# EasyEDA Pro project C8T6v1.eprj, schematic Schematic2
Board Name: Board1; Create Date: 2026-07-19; Page Name: P1; Project Name: 12; Schematic Name: Schematic2; Update Date: 2026-07-23; Company: 嘉立创EDA; Page Size: A4; Version: V1.0
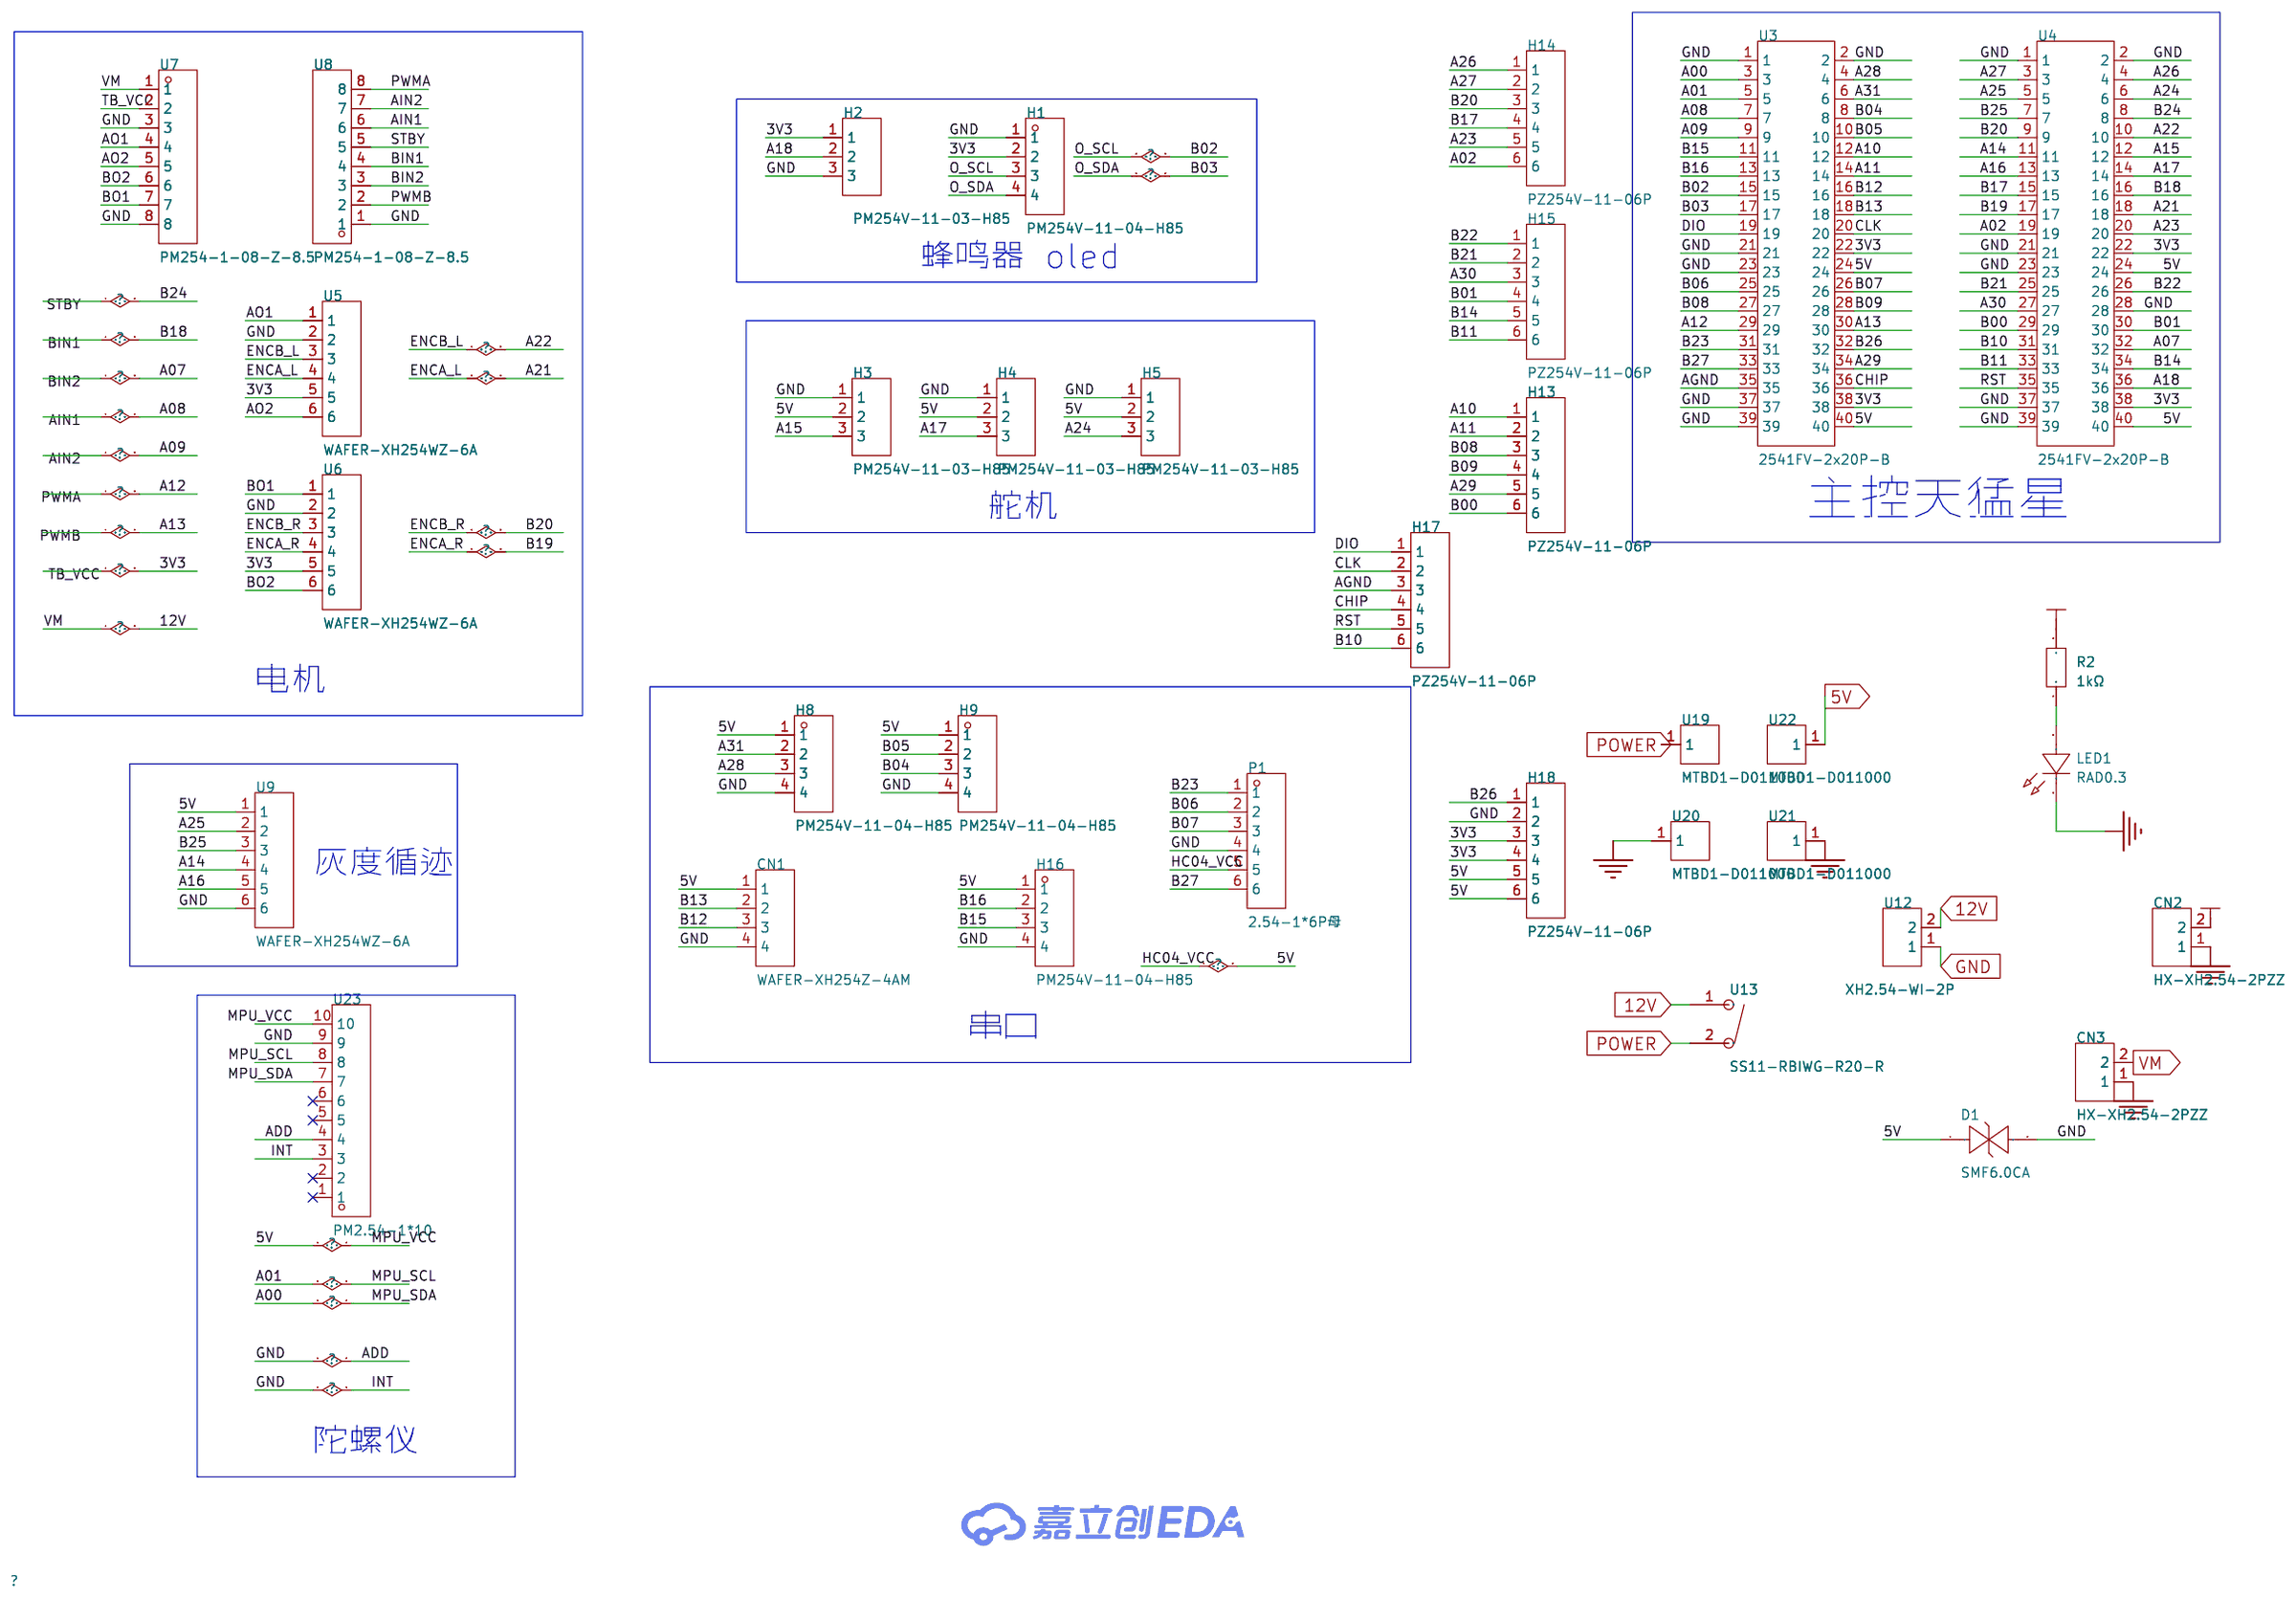
[diagram p1: schematic sheet]

## Parts
CN1  WAFER-XH254Z-4AM  [CONN-TH_WAFER-XH2.54-4PZZ-H62]
CN2  HX-XH2.54-2PZZ  [CONN-TH_2P-P2.50_HX-2.54MM-2P-ZZ-MS]
CN3  HX-XH2.54-2PZZ  [CONN-TH_2P-P2.50_HX-2.54MM-2P-ZZ-MS]
D1  SMF6.0CA  [SOD-123FL_L2.7-W1.8-LS3.8-BI]
H1  PM254V-11-04-H85  [HDR-TH_4P-P2.54-V-F]
H2  PM254V-11-03-H85  [HDR-TH_3P-P2.54-V-F]
H3  PM254V-11-03-H85  [HDR-TH_3P-P2.54-V-F]
H4  PM254V-11-03-H85  [HDR-TH_3P-P2.54-V-F]
H5  PM254V-11-03-H85  [HDR-TH_3P-P2.54-V-F]
H8  PM254V-11-04-H85  [HDR-TH_4P-P2.54-V-F]
H9  PM254V-11-04-H85  [HDR-TH_4P-P2.54-V-F]
H13  PZ254V-11-06P  [HDR-TH_6P-P2.54-V-M]
H14  PZ254V-11-06P  [HDR-TH_6P-P2.54-V-M]
H15  PZ254V-11-06P  [HDR-TH_6P-P2.54-V-M]
H16  PM254V-11-04-H85  [HDR-TH_4P-P2.54-V-F]
H17  PZ254V-11-06P  [HDR-TH_6P-P2.54-V-M]
H18  PZ254V-11-06P  [HDR-TH_6P-P2.54-V-M]
LED1  RAD0.3  [LED-TH_BD3.8-P2.54-RD]
P1  2.54-1*6P母  [HDR-TH_6P-P2.54-V-F]
R2  1kΩ  [RES-TH_BD2.7-L6.2-P10.20-D0.4]
U3  2541FV-2x20P-B  [HDR-TH_40P-P2.54-V-F-R2-C20-S2.54]
U4  2541FV-2x20P-B  [HDR-TH_40P-P2.54-V-F-R2-C20-S2.54]
U5  WAFER-XH254WZ-6A  [CONN-TH_6P-P2.50_WAFER-XH254WZ-6A]
U6  WAFER-XH254WZ-6A  [CONN-TH_6P-P2.50_WAFER-XH254WZ-6A]
U7  PM254-1-08-Z-8.5  [HDR-TH_8P-P2.54-V-F]
U8  PM254-1-08-Z-8.5  [HDR-TH_8P-P2.54-V-F]
U9  WAFER-XH254WZ-6A  [CONN-TH_6P-P2.50_WAFER-XH254WZ-6A]
U12  XH2.54-WI-2P  [CONN-TH_XH2.54-WI-2P]
U13  SS11-RBIWG-R20-R  [SW-TH_L21.0-W15.0_SS11-RBIWG-R20-R]
U19  MTBD1-D011000  [CONN-TH_MTBD1-D011000]
U20  MTBD1-D011000  [CONN-TH_MTBD1-D011000]
U21  MTBD1-D011000  [CONN-TH_MTBD1-D011000]
U22  MTBD1-D011000  [CONN-TH_MTBD1-D011000]
U23  PM2.54-1*10  [HDR-TH_10P-P2.54-V-F]

## Library data of the parts
CN1 = WAFER-XH254Z-4AM: LCSC Part Name: 1x4P 间距:2.54mm 直插 系列:XH; Supplier Part: C22751824; Manufacturer: HANBO(汉博); Supplier Footprint: 插件,P=2.54mm; JLCPCB Part Class: 扩展库; Datasheet: https://item.szlcsc.com/datasheet/WAFER-XH254Z-4AM/24478759.html; Supplier: LCSC; Pins Structure: 1x4P; Pitch: 2.54mm; Mounting Type: 直插; Reference Series: XH; Number of Pins: 4P; Number of Rows: 1; Number of PINs Per Row: 4; Current Rating: 3A; Contact Material: 黄铜; Operating Temperature: -25℃~+85℃; Voltage Rating: 250V; Plastic Material: PA66; Flame Retardant Rating: UL94V-0
CN2 CN3 = HX-XH2.54-2PZZ: LCSC Part Name: 1x2P 间距:2.54mm 直插 系列:XH; Supplier Part: C42391660; Manufacturer: hanxia(韩下); Supplier Footprint: 插件,P=2.5mm; JLCPCB Part Class: 扩展库; Datasheet: https://item.szlcsc.com/datasheet/HX-XH2.54-2PZZ/44326932.html; Supplier: LCSC; Pins Structure: 1x2P; Pitch: 2.54mm; Mounting Type: 直插; Reference Series: XH; Number of Pins: 2P; Number of Rows: 1; Number of PINs Per Row: 2; Current Rating: 3A; Contact Material: 黄铜; Contact Plating: 锡; Operating Temperature: -25℃~+85℃; Voltage Rating: 250V; Plastic Material: PA66; Flame Retardant Rating: UL94V-0; Color: 白色
D1 = SMF6.0CA_C19077500: LCSC Part Name: 双向TVS 6V截止 峰值浪涌电流：19.4A@10/1000us; Supplier Part: C19077500; Manufacturer: R+O(宏嘉诚); Supplier Footprint: SOD-123FL; JLCPCB Part Class: 扩展库; Datasheet: https://item.szlcsc.com/datasheet/SMF6.0CA/20275585.html; Supplier: LCSC; Polarity: 双向; Reverse Stand-Off Voltage (Vrwm): 6V; Clamping Voltage: 10.3V; Peak Pulse Current (Ipp): 19.4A@10/1000us; Peak Pulse Power Dissipation (Ppp): 200W@10/1000us; Voltage - Breakdown: 7.37V; Reverse Leakage Current (Ir): 400uA; Number of Channels: 单路; Operating Temperature: -55℃~+150℃; level of protection: IEC 61000-4-2; Type: TVS
H1 H8 H9 H16 = PM254V-11-04-H85: LCSC Part Name: 1x4P 间距:2.54mm 直插; Supplier Part: C541851; Manufacturer: XFCN(兴飞); Supplier Footprint: 插件,P=2.54mm; JLCPCB Part Class: 扩展库; Datasheet: https://item.szlcsc.com/datasheet/PM254V-11-04-H85/562472.html; Supplier: LCSC; Holes Structure: 1x4P; Pitch: 2.54mm; Circular Hole / Square Hole: 方孔; Mounting Type: 直插; Number of Rows: 单排; Number of Positions: 4P; Current Rating: 3A; Holes Direction: 顶部; Insulation Height: 8.5mm; Contact Material: 黄铜; Operating Temperature: -40℃~+105℃
H2-H5 = PM254V-11-03-H85: LCSC Part Name: 1x3P 间距:2.54mm 直插; Supplier Part: C541850; Manufacturer: XFCN(兴飞); Supplier Footprint: 插件,P=2.54mm; JLCPCB Part Class: 扩展库; Datasheet: https://item.szlcsc.com/datasheet/PM254V-11-03-H85/562471.html; Supplier: LCSC; Holes Structure: 1x3P; Pitch: 2.54mm; Circular Hole / Square Hole: 方孔; Mounting Type: 直插; Number of Rows: 单排; Number of Positions: 3P; Current Rating: 3A; Holes Direction: 顶部; Insulation Height: 8.5mm; Contact Material: 黄铜; Operating Temperature: -40℃~+105℃
H13-H15 H17 H18 = PZ254V-11-06P: LCSC Part Name: 1x6P 间距:2.54mm 方针 直插; Supplier Part: C492405; Manufacturer: XFCN(兴飞); Supplier Footprint: 插件,P=2.54mm; JLCPCB Part Class: 扩展库; Datasheet: https://item.szlcsc.com/datasheet/PZ254V-11-06P/502961.html; Supplier: LCSC; Pin Structure: 1x6P; Pitch: 2.54mm; Circluar Pins/Square Pins: 方针; Mounting Type: 直插; Number of Rows: 单排; Number of Pins: 6P; Current Rating: 3A; Voltage Rating (Max): 250V; Length of Mating Pin: 6mm; Insulation Height: 2.5mm; Length of End Connection Pin: 3mm; Contact Material: 黄铜; Operating Temperature: -40℃~+105℃; Color: 黑色
LED1 = RAD0.3: Supplier Part: C9900004941; Supplier Footprint: LED-TH_BD3.8-P2.54; JLCPCB Part Class: Extended Part; Supplier: LCSC
P1 = 2.54-1*6P母: LCSC Part Name: 1x6P 间距:2.54mm 直插; Supplier Part: C40877; Manufacturer: BOOMELE(博穆精密); Supplier Footprint: 插件,P=2.54mm; JLCPCB Part Class: 扩展库; Datasheet: https://item.szlcsc.com/datasheet/2.54-1*6P%25E6%25AF%258D/41861.html; Supplier: LCSC; Holes Structure: 1x6P; Pitch: 2.54mm; Circular Hole / Square Hole: 方孔; Mounting Type: 直插; Number of Rows: 单排; Number of Positions: 6P; Current Rating: 3A; Holes Direction: 顶部; Contact Material: 黄铜; Operating Temperature: -40℃~+105℃; PIN Length: 3.3mm
R2 = MF1/4W-1K±1%-ST52: LCSC Part Name: 金属膜电阻 1kΩ ±1% 250mW; Supplier Part: C2903245; Manufacturer: VO(翔胜); Supplier Footprint: 插件,D2.7xL6.2mm; JLCPCB Part Class: 扩展库; Datasheet: https://item.szlcsc.com/datasheet/MF1%252F4W-1K%25C2%25B11%2525-ST52/3158996.html; Supplier: LCSC; Type: 金属膜电阻; Tolerance: ±1%; Voltage-Supply(Max): 250V; Power(Watts): 250mW; Temperature Coefficient: ±100ppm/℃; Operating Temperature: -55℃~+155℃
U3 U4 = 2541FV-2x20P-B: LCSC Part Name: 2x20P 间距:2.54mm 直插; Supplier Part: C25503128; Manufacturer: HanElectricity(瀚源); Supplier Footprint: 插件,P=2.54mm; JLCPCB Part Class: 扩展库; Datasheet: https://item.szlcsc.com/datasheet/2541FV-2x20P-B/27233671.html; Supplier: LCSC; Holes Structure: 2x20P; Pitch: 2.54mm; Row Spacing: 2.54mm; Circular Hole / Square Hole: 方孔; Mounting Type: 直插; Number of Rows: 双排; Number of Positions: 40P; Current Rating: 3A; Holes Direction: 顶部; Operating Temperature: -40℃~+105℃
U5 U6 U9 = WAFER-XH254WZ-6A: LCSC Part Name: 1x6P 间距:2.54mm 弯插 系列:XH; Supplier Part: C7432695; Manufacturer: HANBO(汉博); Supplier Footprint: 插件,P=2.5mm; JLCPCB Part Class: 扩展库; Datasheet: https://item.szlcsc.com/datasheet/WAFER-XH254WZ-6A/8437692.html; Supplier: LCSC; Pins Structure: 1x6P; Pitch: 2.54mm; Mounting Type: 弯插; Reference Series: XH; Number of Pins: 6P; Number of Rows: 1; Number of PINs Per Row: 6; Current Rating: 3A; Contact Material: 黄铜; Operating Temperature: -25℃~+85℃; Voltage Rating: 250V; Plastic Material: PA66; Flame Retardant Rating: UL94V-0
U7 U8 = PM254-1-08-Z-8.5: LCSC Part Name: 1x8P 间距:2.54mm 直插; Supplier Part: C2897371; Manufacturer: HCTL(华灿天禄); Supplier Footprint: 插件,P=2.54mm; JLCPCB Part Class: 扩展库; Datasheet: https://item.szlcsc.com/datasheet/PM254-1-08-Z-8.5/3142376.html; Supplier: LCSC; Holes Structure: 1x8P; Pitch: 2.54mm; Circular Hole / Square Hole: 方孔; Mounting Type: 直插; Number of Rows: 单排; Number of Positions: 8P; Current Rating: 3A; Holes Direction: 顶部; Insulation Height: 8.5mm; Contact Material: 铜合金; Operating Temperature: -40℃~+105℃
U12 = XH2.54-WI-2P: Supplier Part: C9900005527; Supplier Footprint: XH2.54MM-2P; JLCPCB Part Class: Extended Part; Supplier: LCSC
U13 = SS11-RBIWG-R20-R: LCSC Part Name: 翘板开关船型开关 电源开关; Supplier Part: C5186963; Manufacturer: Legion(六钧); Supplier Footprint: 插件,21x15mm; JLCPCB Part Class: 扩展库; Datasheet: https://item.szlcsc.com/datasheet/SS11-RBIWG-R20-R/5858598.html; Supplier: LCSC; Length: 21mm; Width: 15mm; Actuator Type: 凹面弯曲; With Lamp: 无; Actuator Color: 红色; Current Rating: 16A; Voltage Rating (AC): 250V; Circuit: 单刀单掷; Life: 1万次; Operating Temperature: -40℃~+125℃; Actuator Identifier: - O
U19-U22 = MTBD1-D011000: LCSC Part Name: 1x1P 间距:2.54mm 直插; Supplier Part: C48983276; Manufacturer: MINTRON(明硕); Supplier Footprint: 插件,P=2.54mm; JLCPCB Part Class: 扩展库; Datasheet: https://item.szlcsc.com/datasheet/MTBD1-D011000/51316311.html; Supplier: LCSC; Holes Structure: 1x1P; Pitch: 2.54mm; Circular Hole / Square Hole: 圆孔; Mounting Type: 直插; Number of Rows: 单排; Number of Positions: 1P; Current Rating: 3A; Holes Direction: 顶部; Insulation Height: 7mm; Operating Temperature: -40℃~+105℃
U23 = PM2.54-1*10: LCSC Part Name: 间距:2.54mm 1x10P 直插; Supplier Part: C5116489; Manufacturer: ZHOURI(洲日); Supplier Footprint: 插件,P=2.54mm; JLCPCB Part Class: 扩展库; Datasheet: https://item.szlcsc.com/datasheet/PM2.54-1*10/5692732.html; Supplier: LCSC; Holes Structure: 1x10P; Pitch: 2.54mm; Row Spacing: 2.54mm; Circular Hole / Square Hole: 方孔; Mounting Type: 直插; Number of Rows: 单排; Number of Positions: 10P; Current Rating: 2.5A; Holes Direction: 顶部; Insulation Height: 8.5mm; Operating Temperature: -40℃~+105℃

## Nets
3V3: H1.2 H2.1 H18.3 H18.4 U3.22 U3.38 U4.22 U4.38 U5.5 U6.5 U7.2
5V: CN1.1 CN2.2 D1.1 H3.2 H4.2 H5.2 H8.1 H9.1 H16.1 H18.5 H18.6 P1.5 R2.2 U3.24 U3.40 U4.24 U4.40 U9.1 U22.1 U23.10
12V: CN3.2 U7.1 U12.2 U13.1
AGND: H17.3 U3.35
GND: CN1.4 CN2.1 CN3.1 D1.2 H1.1 H2.3 H3.1 H4.1 H5.1 H8.4 H9.4 H16.4 H18.2 LED1.1(K) P1.4 U3.1 U3.2 U3.21 U3.23 U3.37 U3.39 U4.1 U4.2 U4.21 U4.23 U4.28 U4.37 U4.39 U5.2 U6.2 U7.3 U7.8 U8.1 U9.6 U12.1 U20.1 U21.1 U23.3 U23.4 U23.9
A00: U3.3 U23.7
A01: U3.5 U23.8
A02: H14.6 U4.19
A07: U4.32 U8.3
A08: U3.7 U8.6
A09: U3.9 U8.7
A10: H13.1 U3.12
A11: H13.2 U3.14
A12: U3.29 U8.8
A13: U3.30 U8.2
A14: U4.11 U9.4
A15: H3.3 U4.12
A16: U4.13 U9.5
A17: H4.3 U4.14
A18: H2.2 U4.36
A21: U4.18 U5.4
A22: U4.10 U5.3
A23: H14.5 U4.20
A24: H5.3 U4.6
A25: U4.5 U9.2
A26: H14.1 U4.4
A27: H14.2 U4.3
A28: H8.3 U3.4
A29: H13.5 U3.34
A30: H15.3 U4.27
A31: H8.2 U3.6
AO1: U5.1 U7.4
AO2: U5.6 U7.5
B00: H13.6 U4.29
B01: H15.4 U4.30
B02: H1.3 U3.15
B03: H1.4 U3.17
B04: H9.3 U3.8
B05: H9.2 U3.10
B06: P1.2 U3.25
B07: P1.3 U3.26
B08: H13.3 U3.27
B09: H13.4 U3.28
B10: H17.6 U4.31
B11: H15.6 U4.33
B12: CN1.3 U3.16
B13: CN1.2 U3.18
B14: H15.5 U4.34
B15: H16.3 U3.11
B16: H16.2 U3.13
B17: H14.4 U4.15
B18: U4.16 U8.4
B19: U4.17 U6.4
B20: H14.3 U4.9 U6.3
B21: H15.2 U4.25
B22: H15.1 U4.26
B23: P1.1 U3.31
B24: U4.8 U8.5
B25: U4.7 U9.3
B26: H18.1 U3.32
B27: P1.6 U3.33
BO1: U6.1 U7.7
BO2: U6.6 U7.6
CHIP: H17.4 U3.36
CLK: H17.2 U3.20
DIO: H17.1 U3.19
POWER: U13.2 U19.1
RST: H17.5 U4.35
$1N3633: LED1.2(A) R2.1

Not connected (* = marked no-connect by the designer): U23 1* 2* 5* 6*

## Notes on the sheet
- 蜂鸣器 oled
- 舵机
- 主控天猛星
- 电机
- 灰度循迹
- 串口
- 陀螺仪
